# Altium project AVP32F069_EVM_Rev1.1_220623.PrjPcb
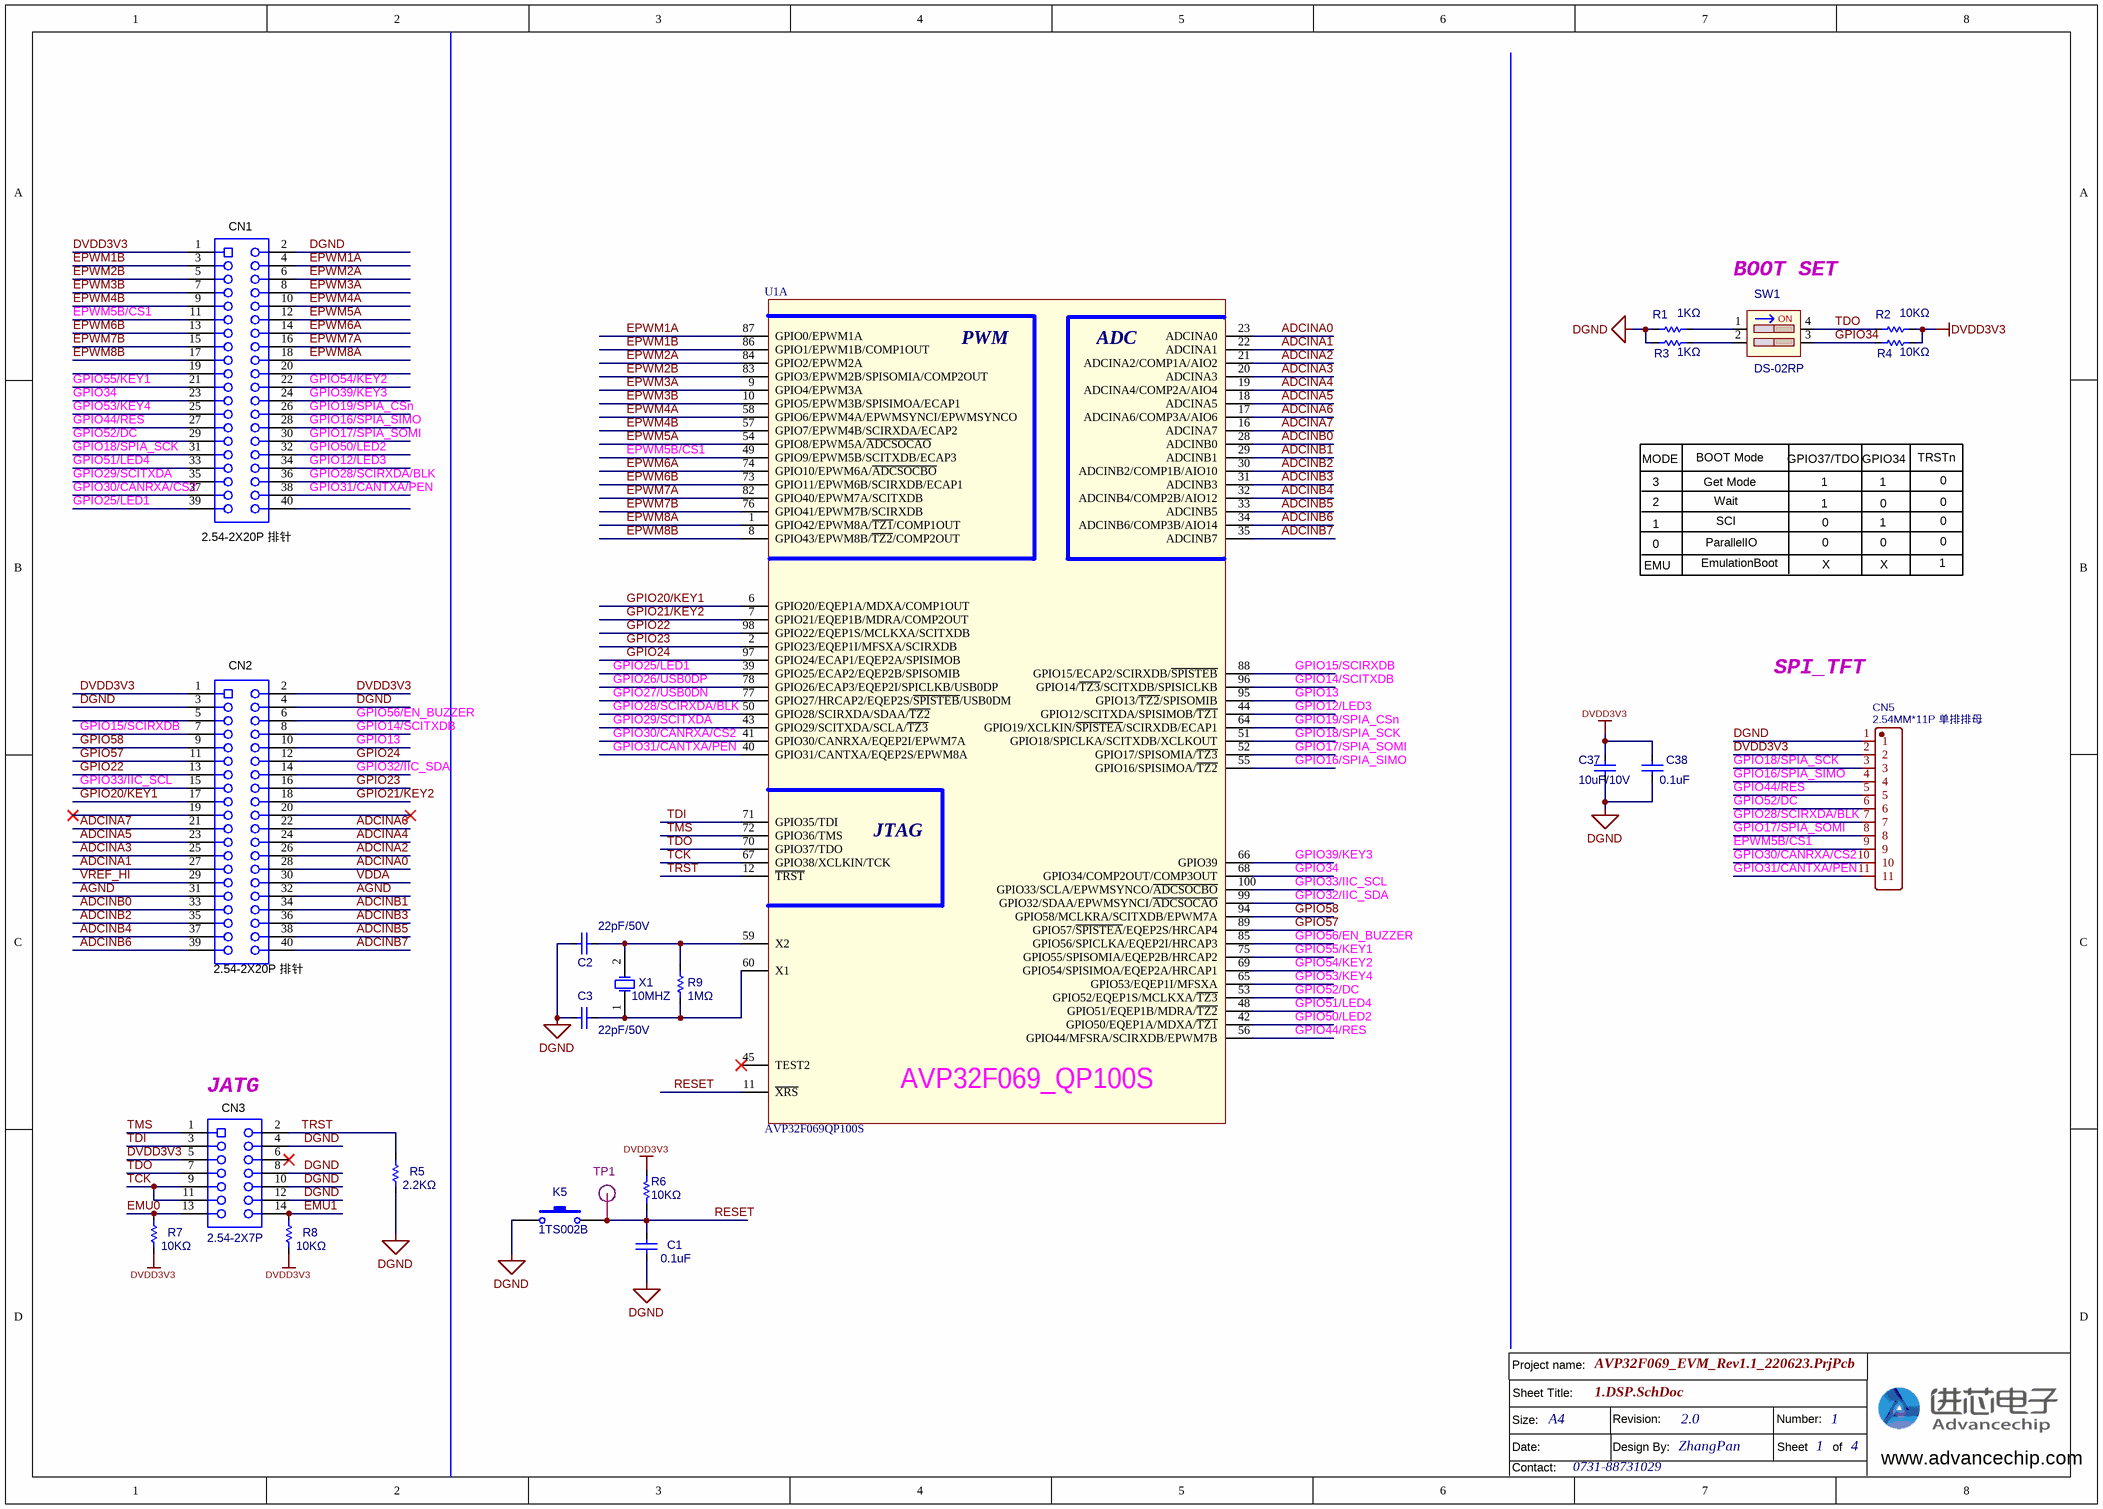
[diagram p0: 1.DSP.SchDoc]
4 sheets, 134 parts. Net scope: global (net labels, ports and power ports of the same name join across sheets).
Board file: AVP32F069_EVM_Rev1.1_220623.PcbDoc
Sheets:
  1.DSP.SchDoc
  2.Power.SchDoc
  3.uC Peripheral.SchDoc
  4.Communication Interface.SchDoc

## Sheet 1.DSP.SchDoc
size A3; Date: 2019/03/06; Author: ZhangPan; Revision: 2.0; SheetNumber: 1; SheetTotal: 4; Size: A4; Contact: 0731-88731029

### Parts
C1  value 0.1uF  [C0603]  (hidden comment: 0.1uF/50V)
C2  22pF/50V  [C0603]
C3  22pF/50V  [C0603]
C37  10uF/10V  [C0805]
C38  value 0.1uF  [C0603]  (hidden comment: 0.1uF/50V)
CN1  2.54-2X20P 排针  [IDC2X20]
CN2  2.54-2X20P 排针  [IDC2X20]
CN3  value 2.54-2X7P  [IDC14-L]  (hidden comment: 2.54-2X7P 简易牛角母座)
CN5  2.54MM*11P 单排排母  [SIP11_TFT]
K5  value 1TS002B  [SW-3X6]  (hidden comment: 1TS002B-2400-5001-CT)
R1  1KΩ  [R0603]
R2  10KΩ  [R0603]
R3  1KΩ  [R0603]
R4  10KΩ  [R0603]
R5  2.2KΩ  [R0603]
R6  10KΩ  [R0603]
R7  10KΩ  [R0603]
R8  10KΩ  [R0603]
R9  1MΩ  [R0603]
SW1  DS-02RP  [DIP-KEY-2]
TP1  RST  [TEST-0.8/1.5MM]  (value not drawn)
U1  AVP32F069QP100S  [LQFP-100]  (part A of 2)
X1  value 10MHZ  [XTAL_5032]  (hidden comment: YSX530GA 10MHZ 20pF 10ppm)

### Nets
AGND: CN2.31 CN2.32
DGND: C1.2 C2.2 C3.1 C37.2 C38.2 CN1.2 CN2.3 CN2.4 CN3.4 CN3.8 CN3.10 CN3.12 CN5.1 K5.2 R1.1 R3.1 R5.1
DVDD3V3: C37.1 C38.1 CN1.1 CN2.1 CN2.2 CN3.5 CN5.2 R2.2 R4.2 R6.1 R7.1 R8.1
VDDA: CN2.30
ADCINA0: CN2.28 U1.23(ADCINA0)
ADCINA1: CN2.27 U1.22(ADCINA1)
ADCINA2: CN2.26 U1.21(ADCINA2/COMP1A/AIO2)
ADCINA3: CN2.25 U1.20(ADCINA3)
ADCINA4: CN2.24 U1.19(ADCINA4/COMP2A/AIO4)
ADCINA5: CN2.23 U1.18(ADCINA5)
ADCINA6: CN2.22 U1.17(ADCINA6/COMP3A/AIO6)
ADCINA7: CN2.21 U1.16(ADCINA7)
ADCINB0: CN2.33 U1.28(ADCINB0)
ADCINB1: CN2.34 U1.29(ADCINB1)
ADCINB2: CN2.35 U1.30(ADCINB2/COMP1B/AIO10)
ADCINB3: CN2.36 U1.31(ADCINB3)
ADCINB4: CN2.37 U1.32(ADCINB4/COMP2B/AIO12)
ADCINB5: CN2.38 U1.33(ADCINB5)
ADCINB6: CN2.39 U1.34(ADCINB6/COMP3B/AIO14)
ADCINB7: CN2.40 U1.35(ADCINB7)
EMU0: CN3.13 R7.2
EMU1: CN3.14 R8.2
EPWM1A: CN1.4 U1.87(GPIO0/EPWM1A)
EPWM1B: CN1.3 U1.86(GPIO1/EPWM1B/COMP1OUT)
EPWM2A: CN1.6 U1.84(GPIO2/EPWM2A)
EPWM2B: CN1.5 U1.83(GPIO3/EPWM2B/SPISOMIA/COMP2OUT)
EPWM3A: CN1.8 U1.9(GPIO4/EPWM3A)
EPWM3B: CN1.7 U1.10(GPIO5/EPWM3B/SPISIMOA/ECAP1)
EPWM4A: CN1.10 U1.58(GPIO6/EPWM4A/EPWMSYNCI/EPWMSYNCO)
EPWM4B: CN1.9 U1.57(GPIO7/EPWM4B/SCIRXDA/ECAP2)
EPWM5A: CN1.12 U1.54(GPIO8/EPWM5A/~{ADCSOCAO})
EPWM5B/CS1: CN1.11 CN5.9 U1.49(GPIO9/EPWM5B/SCITXDB/ECAP3)
EPWM6A: CN1.14 U1.74(GPIO10/EPWM6A/~{ADCSOCBO})
EPWM6B: CN1.13 U1.73(GPIO11/EPWM6B/SCIRXDB/ECAP1)
EPWM7A: CN1.16 U1.82(GPIO40/EPWM7A/SCITXDB)
EPWM7B: CN1.15 U1.76(GPIO41/EPWM7B/SCIRXDB)
EPWM8A: CN1.18 U1.1(GPIO42/EPWM8A/~{TZ1}/COMP1OUT)
EPWM8B: CN1.17 U1.8(GPIO43/EPWM8B/~{TZ2}/COMP2OUT)
GPIO12/LED3: CN1.34 U1.44(GPIO12/SCITXDA/SPISIMOB/~{TZ1})
GPIO13: CN2.10 U1.95(GPIO13/~{TZ2}/SPISOMIB)
GPIO14/SCITXDB: CN2.8 U1.96(GPIO14/~{TZ3}/SCITXDB/SPISICLKB)
GPIO15/SCIRXDB: CN2.7 U1.88(GPIO15/ECAP2/SCIRXDB/~{SPISTEB})
GPIO16/SPIA_SIMO: CN1.28 CN5.4 U1.55(GPIO16/SPISIMOA/~{TZ2})
GPIO17/SPIA_SOMI: CN1.30 CN5.8 U1.52(GPIO17/SPISOMIA/~{TZ3})
GPIO18/SPIA_SCK: CN1.31 CN5.3 U1.51(GPIO18/SPICLKA/SCITXDB/XCLKOUT)
GPIO19/SPIA_CSn: CN1.26 U1.64(GPIO19/XCLKIN/~{SPISTEA}/SCIRXDB/ECAP1)
GPIO20/KEY1: CN2.17 U1.6(GPIO20/EQEP1A/MDXA/COMP1OUT)
GPIO21/KEY2: CN2.18 U1.7(GPIO21/EQEP1B/MDRA/COMP2OUT)
GPIO22: CN2.13 U1.98(GPIO22/EQEP1S/MCLKXA/SCITXDB)
GPIO23: CN2.16 U1.2(GPIO23/EQEP1I/MFSXA/SCIRXDB)
GPIO24: CN2.12 U1.97(GPIO24/ECAP1/EQEP2A/SPISIMOB)
GPIO25/LED1: CN1.39 U1.39(GPIO25/ECAP2/EQEP2B/SPISOMIB)
GPIO26/USB0DP: U1.78(GPIO26/ECAP3/EQEP2I/SPICLKB/USB0DP)
GPIO27/USB0DN: U1.77(GPIO27/HRCAP2/EQEP2S/~{SPISTEB}/USB0DM)
GPIO28/SCIRXDA/BLK: CN1.36 CN5.7 U1.50(GPIO28/SCIRXDA/SDAA/~{TZ2})
GPIO29/SCITXDA: CN1.35 U1.43(GPIO29/SCITXDA/SCLA/~{TZ3})
GPIO30/CANRXA/CS2: CN1.37 CN5.10 U1.41(GPIO30/CANRXA/EQEP2I/EPWM7A)
GPIO31/CANTXA/PEN: CN1.38 CN5.11 U1.40(GPIO31/CANTXA/EQEP2S/EPWM8A)
GPIO32/IIC_SDA: CN2.14 U1.99(GPIO32/SDAA/EPWMSYNCI/~{ADCSOCAO})
GPIO33/IIC_SCL: CN2.15 U1.100(GPIO33/SCLA/EPWMSYNCO/~{ADCSOCBO})
GPIO34: CN1.23 R4.1 SW1.3 U1.68(GPIO34/COMP2OUT/COMP3OUT)
GPIO39/KEY3: CN1.24 U1.66(GPIO39)
GPIO44/RES: CN1.27 CN5.5 U1.56(GPIO44/MFSRA/SCIRXDB/EPWM7B)
GPIO50/LED2: CN1.32 U1.42(GPIO50/EQEP1A/MDXA/~{TZ1})
GPIO51/LED4: CN1.33 U1.48(GPIO51/EQEP1B/MDRA/~{TZ2})
GPIO52/DC: CN1.29 CN5.6 U1.53(GPIO52/EQEP1S/MCLKXA/~{TZ3})
GPIO53/KEY4: CN1.25 U1.65(GPIO53/EQEP1I/MFSXA)
GPIO54/KEY2: CN1.22 U1.69(GPIO54/SPISIMOA/EQEP2A/HRCAP1)
GPIO55/KEY1: CN1.21 U1.75(GPIO55/SPISOMIA/EQEP2B/HRCAP2)
GPIO56/EN_BUZZER: CN2.6 U1.85(GPIO56/SPICLKA/EQEP2I/HRCAP3)
GPIO57: CN2.11 U1.89(GPIO57/~{SPISTEA}/EQEP2S/HRCAP4)
GPIO58: CN2.9 U1.94(GPIO58/MCLKRA/SCITXDB/EPWM7A)
RESET: C1.1 K5.1 R6.2 TP1.1 U1.11(~{XRS})
TCK: CN3.9 CN3.11 U1.67(GPIO38/XCLKIN/TCK)
TDI: CN3.3 U1.71(GPIO35/TDI)
TDO: CN3.7 R2.1 SW1.4 U1.70(GPIO37/TDO)
TMS: CN3.1 U1.72(GPIO36/TMS)
TRST: CN3.2 R5.2 U1.12(~{TRST})
VREF_HI: CN2.29
NetC2_1: C2.1 R9.1 U1.59(X2) X1.2(OSC2)
NetC3_2: C3.2 R9.2 U1.60(X1) X1.1(OSC1)
NetR1_2: R1.2 SW1.1
NetR3_2: R3.2 SW1.2

Not connected (* = marked no-connect by the designer): CN1 19 20 40; CN2 5 19* 20*; CN3 6*; U1 45(TEST2)*

### Notes on the sheet
- BOOT SET
- BOOT Mode
- TRSTn
- 3
- 2
- 1
- MODE
- Wait
- SCI
- Get Mode
- GPIO37/TDO
- 0
- GPIO34
- EMU
- ParallelIO
- EmulationBoot
- X
- SPI_TFT
- (near CN3) JATG
- Sheet Title:
- Project name:
- Size:
- Date:
- Contact:
- Revision:
- Design By:
- Number:
- Sheet       of
- www.advancechip.com
- (in symbol AVP32F069QP100S, part A) PWM; ADC; JTAG; AVP32F069_QP100S
- (in symbol SW-2B) ON

### Library data of the parts
C1 C37 C38 = Cap: 贴片电容; Published: 8-Jun-2000; LatestRevisionDate: 17-Jul-2002; LatestRevisionNote: Re-released for DXP Platform.; Publisher: Altium Limited
  C37: Value: 10uF/10V
C2 C3 = Cap: COG贴片电容; Value: 100pF; Published: 8-Jun-2000; LatestRevisionDate: 17-Jul-2002; LatestRevisionNote: Re-released for DXP Platform.; Publisher: Altium Limited
CN1 CN2 = CON 20X2A: 连接器
CN3 = Receptacle_7X2: 连接器
CN5 = KH-2.54FH-1X11P-H8.5: 连接器; BOM_Manufacturer: kinghelm(金航标); Contributor: LCSC; BOM_Supplier: LCSC; BOM_Supplier Part: C2932674; BOM_Manufacturer Part: KH-2.54FH-1X11P-H8.5; spicePre: U; spiceSymbolName: KH-2.54FH-1X11P-H8.5
K5 = SW-PB: 鸿源精密轻触开关3X6; Published: 24-Mar-1999; LatestRevisionDate: 17-Jul-2002; LatestRevisionNote: Re-released for DXP Platform.; Publisher: Altium Limited
R1-R9 = Res: 贴片电阻; Value: 1K; Published: 8-Jun-2000; LatestRevisionDate: 17-Jul-2002; LatestRevisionNote: Re-released for DXP Platform.; Publisher: Altium Limited
SW1 = SW-2B: 红色2PIN-2.54mm立式直插正拨拨码开关; Published: 24-Mar-1999; LatestRevisionDate: 17-Jul-2002; LatestRevisionNote: Re-released for DXP Platform.; Publisher: Altium Limited
TP1 = TP: 测试点
U1 = AVP32F069QP100S: 进芯32位浮点DSP
X1 = XTAL: 5032贴片无源晶振; Published: 8-Jun-2000; LatestRevisionDate: 17-Jul-2002; LatestRevisionNote: Re-released for DXP Platform.; Publisher: Altium Limited

## Sheet 2.Power.SchDoc: TopLevel Schematic
size A4; Date: 2022/5/12; Author: DaiJun; Revision: 1.0; SheetNumber: 2; SheetTotal: 4; Size: A4; Contact: 0731-88731029
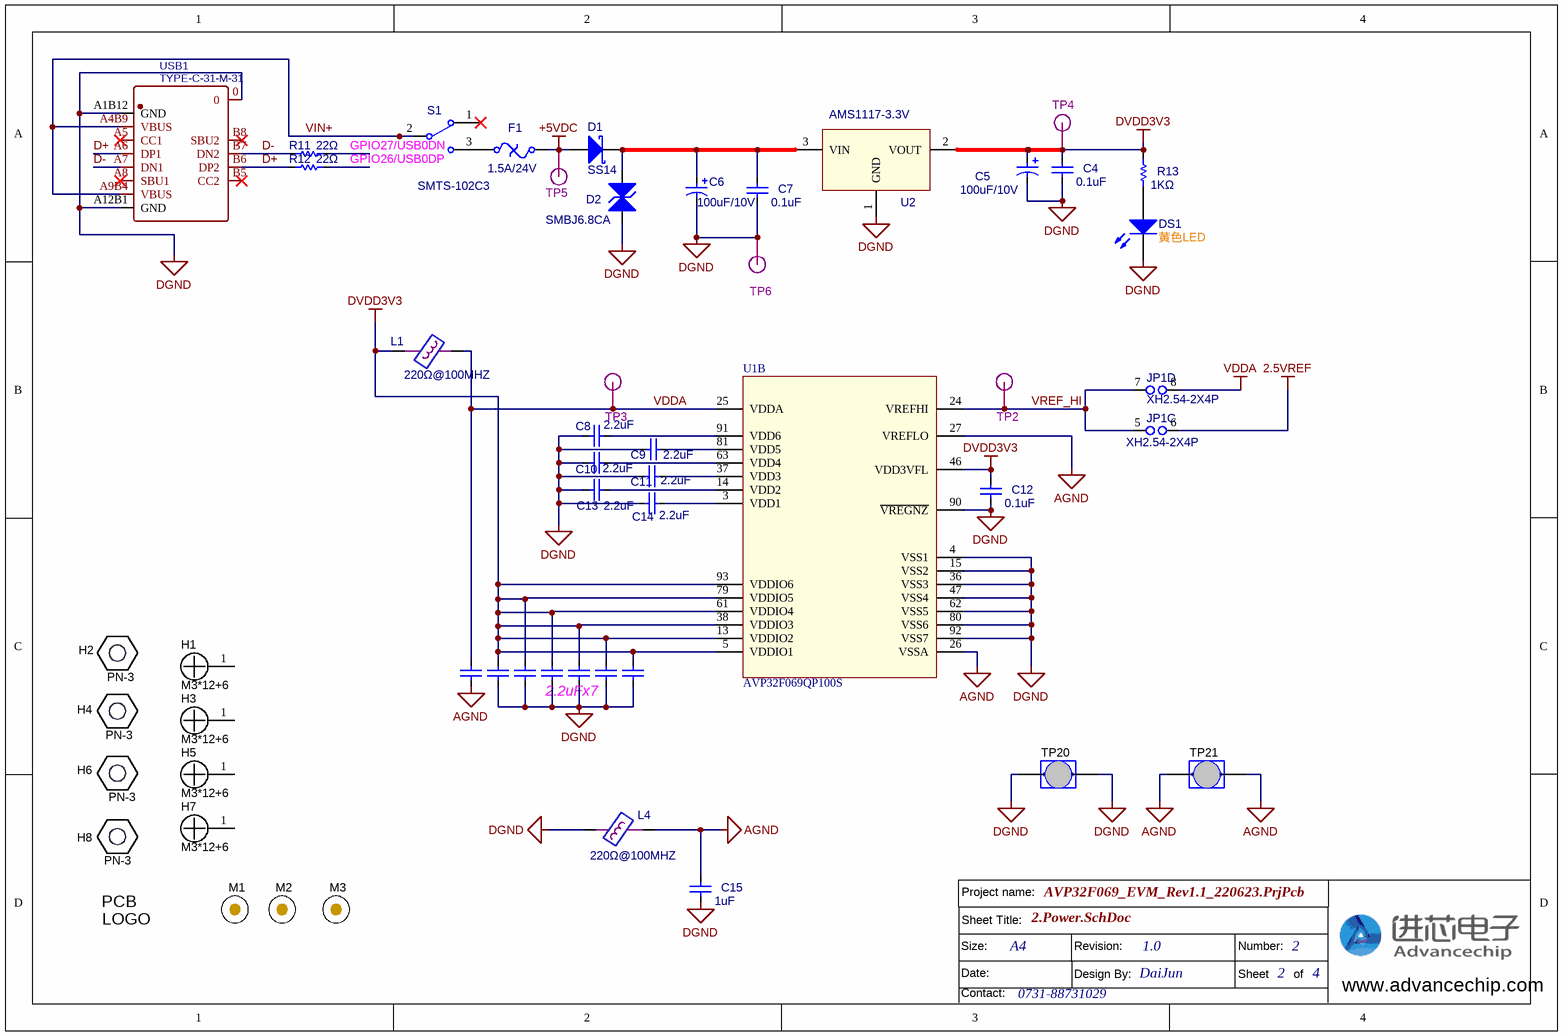
[diagram p1: 2.Power.SchDoc]

### Parts
C4  value 0.1uF  [C0603]  (hidden comment: 0.1uF/50V)
C5  100uF/10V  [CASE-B_3528]
C6  100uF/10V  [CASE-B_3528]
C7  value 0.1uF  [C0603]  (hidden comment: 0.1uF/50V)
C8  value 2.2uF  [C0603]  (hidden comment: 2.2uF/25V)
C9  value 2.2uF  [C0603]  (hidden comment: 2.2uF/25V)
C10  value 2.2uF  [C0603]  (hidden comment: 2.2uF/25V)
C11  value 2.2uF  [C0603]  (hidden comment: 2.2uF/25V)
C12  value 0.1uF  [C0603]  (hidden comment: 0.1uF/50V)
C13  value 2.2uF  [C0603]  (hidden comment: 2.2uF/25V)
C14  value 2.2uF  [C0603]  (hidden comment: 2.2uF/25V)
C15  value 1uF  [C0603]  (hidden comment: 1uF/25V)
C23  2.2uF  [C0603]  (value not drawn)
C26  2.2uF  [C0603]  (value not drawn)
C29  2.2uF  [C0603]  (value not drawn)
C30  2.2uF  [C0603]  (value not drawn)
C31  2.2uF  [C0603]  (value not drawn)
C32  2.2uF  [C0603]  (value not drawn)
C33  2.2uF  [C0603]  (value not drawn)
D1  SS14  [SMA]
D2  SMBJ6.8CA  [SMB2]
DS1  黄色LED  [SMD_LED0805_LED]
F1  1.5A/24V  [1812_PTC_NP]
H1  M3*12+6  [NY PMS 440 0025 PH]
H2  PN-3  [Keystone_1902C]
H3  M3*12+6  [NY PMS 440 0025 PH]
H4  PN-3  [Keystone_1902C]
H5  M3*12+6  [NY PMS 440 0025 PH]
H6  PN-3  [Keystone_1902C]
H7  M3*12+6  [NY PMS 440 0025 PH]
H8  PN-3  [Keystone_1902C]
JP1  XH2.54-2X4P  [SIP4X2A]  (parts C,D of 4)
L1  value 220Ω@100MHZ  [L-0805]  (hidden comment: BLM21PG221SN)
L4  value 220Ω@100MHZ  [L-0805]  (hidden comment: BLM21PG221SN)
Logo1  CAUTION.  READ USER GUIDE BEFORE USE  [IEC_Caution_Small]  (value not drawn)  (no BOM)
M1  (no value)  [Mark1]
M2  (no value)  [Mark1]
M3  (no value)  [Mark1]
R11  22Ω  [0805RX]
R12  22Ω  [0805RX]
R13  1KΩ  [R0603]
S1  SMTS-102C3  [SW2]
TP2  VREFHI  [TEST-0.8/1.5MM]  (value not drawn)
TP3  VDDA  [TEST-0.8/1.5MM]  (value not drawn)
TP4  +3V3  [TEST-0.8/1.5MM]  (value not drawn)
TP5  VIN+  [TEST-0.8/1.5MM]  (value not drawn)
TP6  DGND  [TEST-0.8/1.5MM]  (value not drawn)
TP20  D3082-05  [Harwin_D3082-05]  (value not drawn)
TP21  D3082-05  [Harwin_D3082-05]  (value not drawn)
U1  AVP32F069QP100S  (part B of 2)
U2  AMS1117-3.3V  [SOT-223]
USB1  TYPE-C-31-M-31  [USB-C-SMD-16P]

### Nets
2.5VREF: JP1.6
+5VDC: D1.1 F1.2 TP5.1
AGND: C15.1 C23.1 L4.2 TP21.1 TP21.2 U1.26(VSSA) U1.27(VREFLO)
DGND: C4.2 C5.2 C6.2 C7.2 C8.1 C9.1 C10.1 C11.1 C12.2 C13.1 C14.1 C15.2 C26.1 C29.1 C30.1 C31.1 C32.1 C33.1 D2.1(A) DS1.2(K) L4.1 TP6.1 TP20.1 TP20.2 U1.4(VSS1) U1.15(VSS2) U1.36(VSS3) U1.47(VSS4) U1.62(VSS5) U1.80(VSS6) U1.90(~{VREGNZ}) U1.92(VSS7) U2.1(GND) USB1.0 USB1.A1B12(GND) USB1.A12B1(GND)
DVDD3V3: C4.1 C5.1 C12.1 C26.2 C29.2 C30.2 C31.2 C32.2 C33.2 L1.2 R13.1 TP4.1 U1.5(VDDIO1) U1.13(VDDIO2) U1.38(VDDIO3) U1.46(VDD3VFL) U1.61(VDDIO4) U1.79(VDDIO5) U1.93(VDDIO6) U2.2(VOUT)
VDDA: C23.2 JP1.8 L1.1 TP3.1 U1.25(VDDA)
D+: R12.1 USB1.A6(DP1) USB1.B6(DP2)
D-: R11.1 USB1.A7(DN1) USB1.B7(DN2)
GPIO26/USB0DP: R12.2
GPIO27/USB0DN: R11.2
VIN+: S1.2 USB1.A4B9(VBUS) USB1.A9B4(VBUS)
VREF_HI: JP1.5 JP1.7 TP2.1 U1.24(VREFHI)
NetC6_1: C6.1 C7.1 D1.2 D2.2(K) U2.3(VIN)
NetC8_2: C8.2 U1.81(VDD5)
NetC9_2: C9.2 U1.37(VDD3)
NetC10_2: C10.2 U1.63(VDD4)
NetC11_2: C11.2 U1.14(VDD2)
NetC13_2: C13.2 U1.91(VDD6)
NetC14_2: C14.2 U1.3(VDD1)
NetDS1_1: DS1.1(A) R13.2
NetF1_1: F1.1 S1.3

Not connected (* = marked no-connect by the designer): H1 1; H3 1; H5 1; H7 1; S1 1*; USB1 A5(CC1)* A8(SBU1)* B5(CC2)* B8(SBU2)*

### Notes on the sheet
- 2.2uFx7
- Sheet Title:
- Project name:
- Size:
- Date:
- Contact:
- Revision:
- Design By:
- Number:
- Sheet       of
- www.advancechip.com
- (in symbol CMP-0074836-1) PCB; LOGO

### Library data of the parts
C4 C7-C15 C23 C26 C29-C33 = Cap: 贴片电容; Published: 8-Jun-2000; LatestRevisionDate: 17-Jul-2002; LatestRevisionNote: Re-released for DXP Platform.; Publisher: Altium Limited
  C23 C26 C29-C33: Value: 2.2uF
C5 C6 = CAP2: 钽电容; Brand Name: 三星; Tolerance error: 10%; cost: ￥0.01
D1 = D Schottky: 肖特基二极管; Published: 8-Jun-2000; LatestRevisionDate: 17-Jul-2002; LatestRevisionNote: Re-released for DXP Platform.; Publisher: Altium Limited; Code_JEDEC: DO-214-AA
D2 = TVS: TVS二极管; Published: 8-Jun-2000; LatestRevisionDate: 17-Jul-2002; LatestRevisionNote: Re-released for DXP Platform.; Publisher: Altium Limited
DS1 = LED0: 发光二极管; Published: 8-Jun-2000; LatestRevisionDate: 08-Jul-2005; LatestRevisionNote: Mech Layer 1 removed.; PackageReference: LED-0; Publisher: Altium Limited; PackageDescription: LED; 2 Leads
F1 = Fuse Thermal: 自恢复保险丝; Published: 24-Mar-1999; LatestRevisionDate: 17-Jul-2002; LatestRevisionNote: Re-released for DXP Platform.; PackageReference: PIN-W2/E2.8; Publisher: Altium Limited
H1 H3 H5 H7 = CMP-0003617-1: 安装孔
H2 H4 H6 H8 = CMP-0003610-1: Standoff, Hex, 0.5"L #4-40 Nylon
JP1 = Jumper2: 2.54双排插针; Published: 24-Mar-1999; LatestRevisionDate: 17-Jul-2002; LatestRevisionNote: Re-released for DXP Platform.; Publisher: Altium Limited
L1 L4 = FB1: 贴片电感; Code_IEC: 1005; Published: 8-Jun-2000; LatestRevisionDate: 29-May-2009; LatestRevisionNote: IPC-7351 Footprint Added.; PackageReference: 0402-A; Publisher: Altium Limited; PackageDescription: Chip Inductor; Code_JEITA: 0402
Logo1 = CMP-0074836-1: IEC 61010-1 Caution Warning
M1-M3 = CMP-0077181-1: MARK点
R11-R13 = Res: 贴片电阻; Value: 1K; Published: 8-Jun-2000; LatestRevisionDate: 17-Jul-2002; LatestRevisionNote: Re-released for DXP Platform.; Publisher: Altium Limited
S1 = SW-SPDT: 红色卧式弯脚小型扭子开关5脚2档; Published: 24-Mar-1999; LatestRevisionDate: 17-Dec-2003; LatestRevisionNote: Schematic revised, PCB Footprint replaced.; DatasheetDocument: 05-Dec-2000; Publisher: Altium Limited
TP2-TP6 = TP: 测试点
TP20 TP21 = CMP-0075110-1: 锰铜采样电阻 脚距10mm; Manufacturer: Harwin; CompType: Jumper Wire; CNHeader: False; Green_Lifecycle: Active; Green_REACh: Passed; PartNumber: D3082-05; PackageReference: Shorting Plug, 10.16mm spacing, TH; RoHS: Y; MountType: TH; ComponentLink1Description: Datasheet URL; ComponentLink1URL: http://cdn.harwin.com/pdfs/D3080-D3083.pdf; Publisher: Texas Instruments; LatestRevisionDate: 2017-07-12; Supplier 1: Digi-Key; Supplier Part Number 1: 952-1873-ND; Supplier 2: Newark; Supplier Part Number 2: 01E9240; Supplier 3: Mouser; Supplier Part Number 3: 855-D3082-05; CT: False; Green_EU RoHS-2: Passed; Green_EU RoHS: Passed with Exemption
U1 = AVP32F069QP100S: 进芯32位浮点DSP
U2 = ASM1117-3.3V: 线性稳压器
USB1 = TYPE-C-31-M-31: Type-C 母座 卧贴; BOM_Manufacturer: 韩国韩荣; Contributor: LCSC; BOM_Supplier: LCSC; BOM_Supplier Part: C2760486; BOM_Manufacturer Part: TYPE-C-31-M-31; JLCPCB Part Class: Extended Part; BOM_JLCPCB Part Class: Extended Part; spicePre: U; spiceSymbolName: TYPE-C-31-M-31

## Sheet 3.uC Peripheral.SchDoc: TopLevel Schematic
size A3; Date: 2019/03/06; Author: ZhangPan; Revision: 2.0; SheetNumber: 3; SheetTotal: 4; Size: A4; Contact: 0731-88731029; ProjectName: EVM
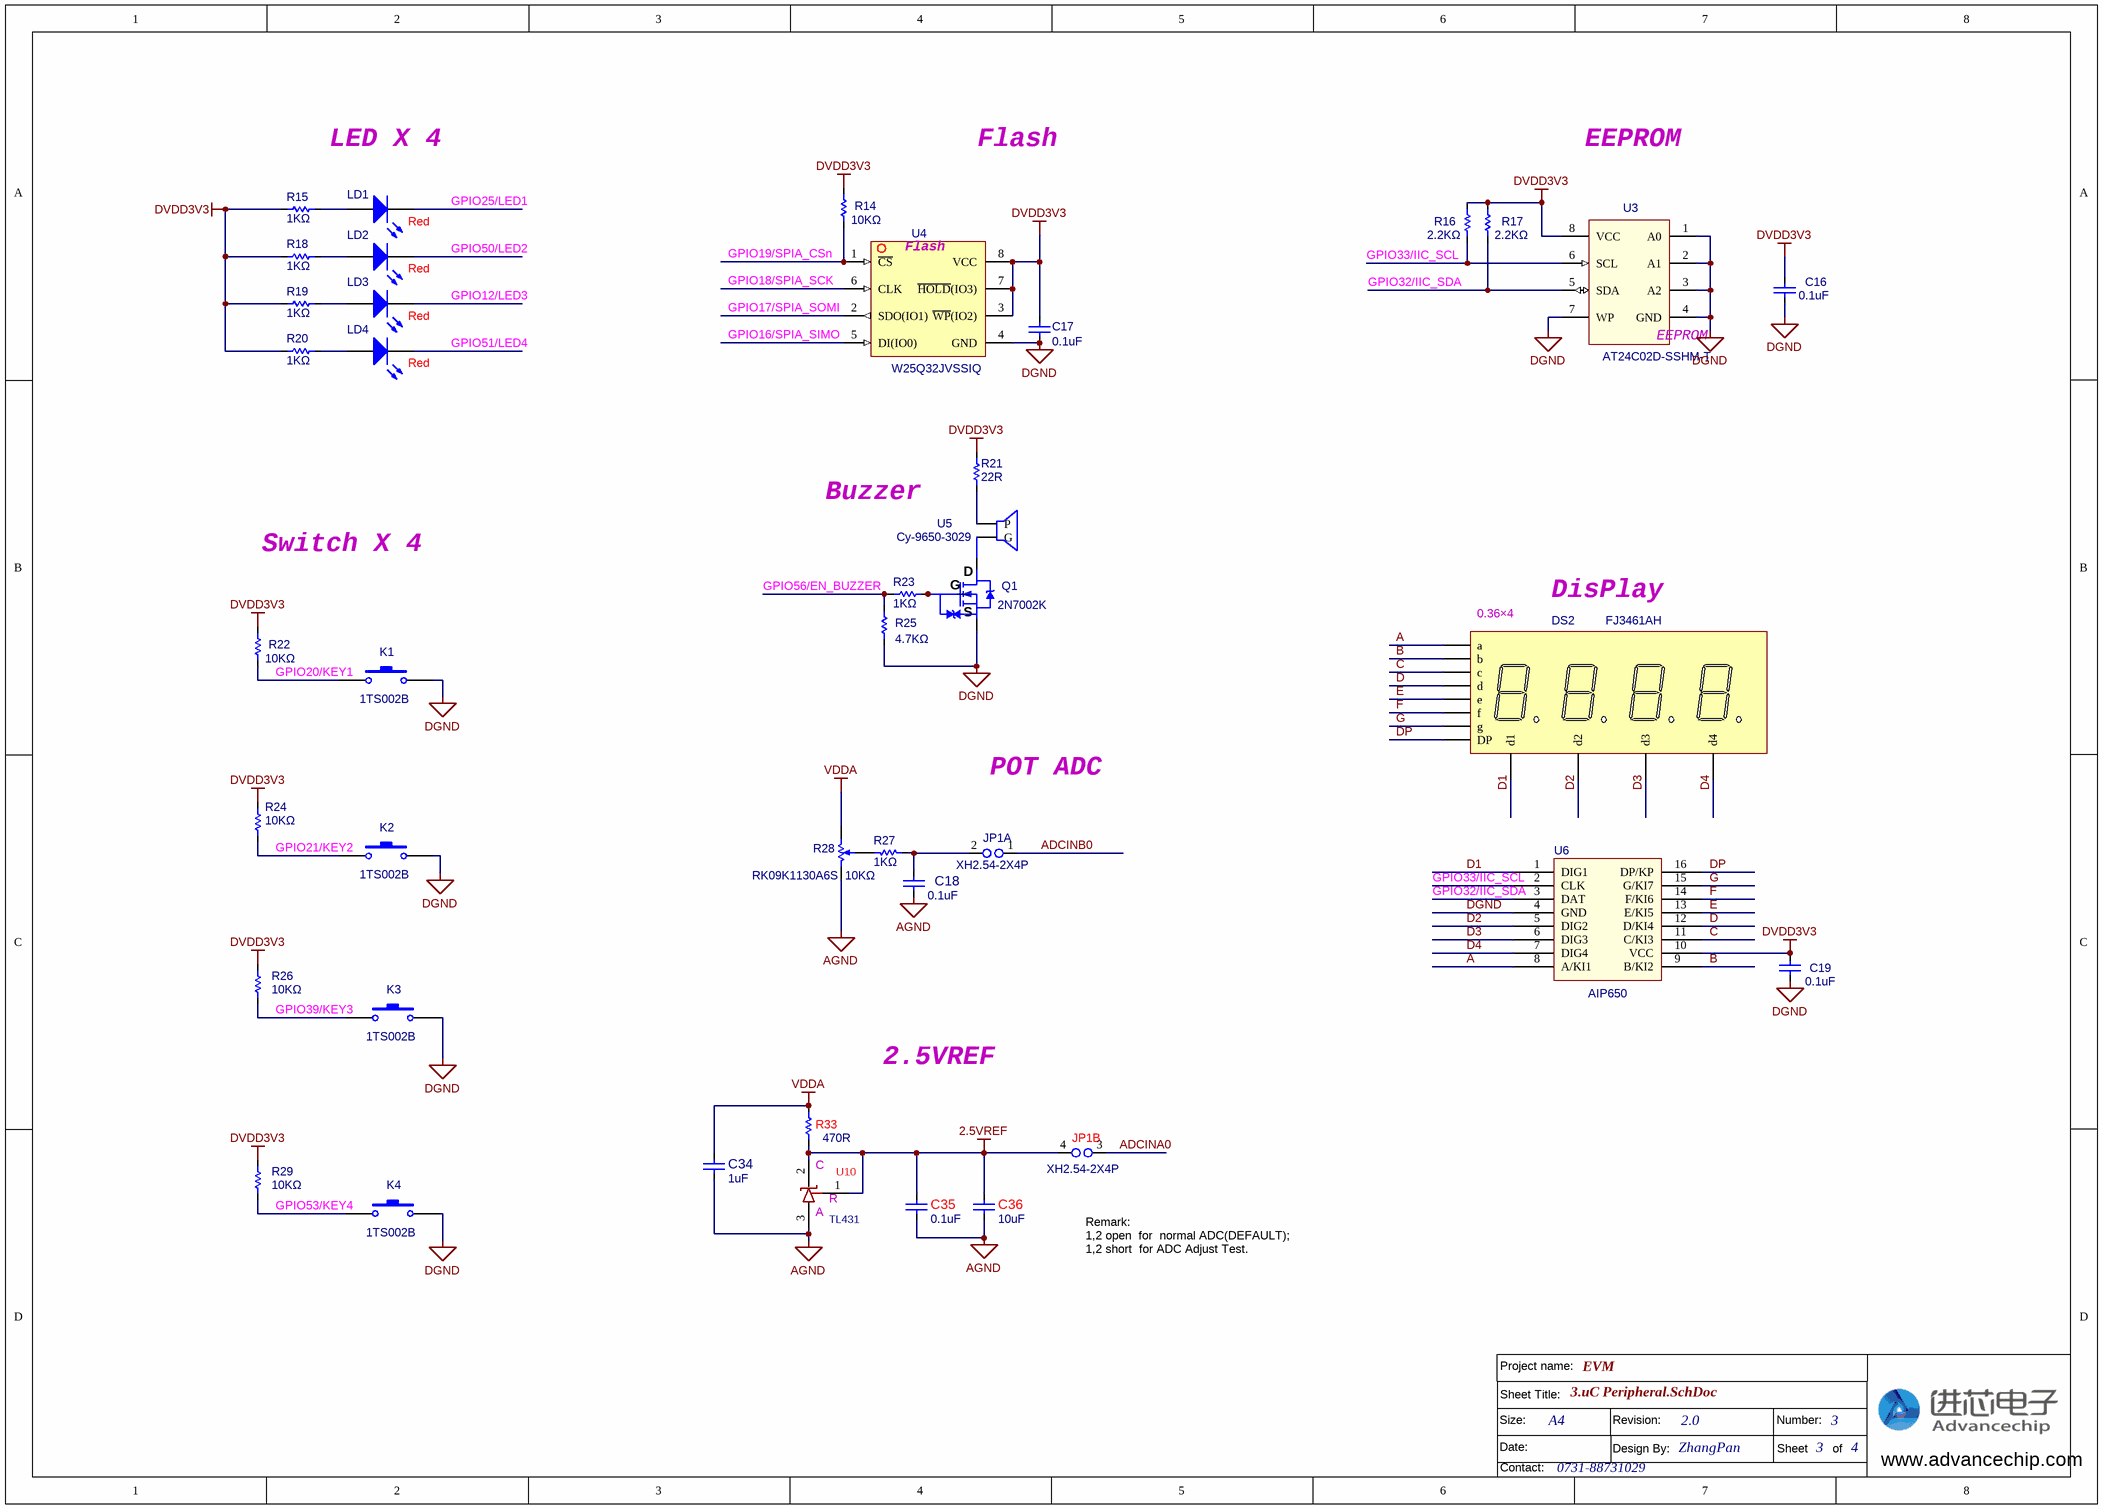
[diagram p2: 3.uC Peripheral.SchDoc]

### Parts
C16  value 0.1uF  [C0603]  (hidden comment: 0.1uF/50V)
C17  value 0.1uF  [C0603]  (hidden comment: 0.1uF/50V)
C18  value 0.1uF  [C0603]  (hidden comment: 0.1uF/50V)
C19  value 0.1uF  [C0603]  (hidden comment: 0.1uF/50V)
C34  value 1uF  [C0603]  (hidden comment: 1uF/25V)
C35  value 0.1uF  [C0603]  (hidden comment: 0.1uF/50V)
C36  value 10uF  [C0805]  (hidden comment: 10uF/10V)
DS2  FJ3461AH  value 0.36×4  [0.36X4]
JP1  XH2.54-2X4P  [SIP4X2A]  (parts A,B of 4)
K1  value 1TS002B  [SW-3X6]  (hidden comment: 1TS002B-2400-5001-CT)
K2  value 1TS002B  [SW-3X6]  (hidden comment: 1TS002B-2400-5001-CT)
K3  value 1TS002B  [SW-3X6]  (hidden comment: 1TS002B-2400-5001-CT)
K4  value 1TS002B  [SW-3X6]  (hidden comment: 1TS002B-2400-5001-CT)
LD1  Red  [SMD_LED0805_LED]
LD2  Red  [SMD_LED0805_LED]
LD3  Red  [SMD_LED0805_LED]
LD4  Red  [SMD_LED0805_LED]
Q1  2N7002K  [MOS-SOT23]
R14  10KΩ  [R0603]
R15  1KΩ  [R0603]
R16  2.2KΩ  [R0603]
R17  2.2KΩ  [R0603]
R18  1KΩ  [R0603]
R19  1KΩ  [R0603]
R20  1KΩ  [R0603]
R21  22R  [1206RX]
R22  10KΩ  [R0603]
R23  1KΩ  [R0603]
R24  10KΩ  [R0603]
R25  4.7KΩ  [R0603]
R26  10KΩ  [R0603]
R27  1KΩ  [R0603]
R28  RK09K1130A6S  10KΩ  [RK09K1130]
R29  10KΩ  [R0603]
R33  470R  [R0603]
U3  AT24C02D-SSHM-T  [SO-8]
U4  W25Q32JVSSIQ  [SOIC-8_208mil]
U5  Cy-9650-3029  [SUN-0905-3V]
U6  AIP650  [SOIC-16_150mil]
U10  TL431  [SOT-23]

### Nets
2.5VREF: C35.1 C36.1 JP1.4 R33.2 U10.1(R) U10.2(C)
AGND: C18.2 C34.2 C35.2 C36.2 R28.1 U10.3(A)
DGND: C16.2 C17.2 C19.2 K1.2 K2.2 K3.2 K4.2 Q1.S R25.2 U3.1(A0) U3.2(A1) U3.3(A2) U3.4(GND) U3.7(WP) U4.4(GND) U6.4(GND)
DVDD3V3: C16.1 C17.1 C19.1 R14.1 R15.2 R16.2 R17.2 R18.2 R19.2 R20.2 R21.1 R22.1 R24.1 R26.1 R29.1 U3.8(VCC) U4.3(~{WP}(IO2)) U4.7(~{HOLD}(IO3)) U4.8(VCC) U6.10(VCC)
VDDA: C34.1 R28.3 R33.1
A: DS2.a U6.8(A/KI1)
ADCINA0: JP1.3
ADCINB0: JP1.1
B: DS2.b U6.9(B/KI2)
C: DS2.c U6.11(C/KI3)
D: DS2.d U6.12(D/KI4)
D1: DS2.com1(d1) U6.1(DIG1)
D2: DS2.com2(d2) U6.5(DIG2)
D3: DS2.com3(d3) U6.6(DIG3)
D4: DS2.com4(d4) U6.7(DIG4)
DP: DS2.dp(DP) U6.16(DP/KP)
E: DS2.e U6.13(E/KI5)
F: DS2.f U6.14(F/KI6)
G: DS2.g U6.15(G/KI7)
GPIO12/LED3: LD3.2(K)
GPIO16/SPIA_SIMO: U4.5(DI(IO0))
GPIO17/SPIA_SOMI: U4.2(SDO(IO1))
GPIO18/SPIA_SCK: U4.6(CLK)
GPIO19/SPIA_CSn: R14.2 U4.1(~{CS})
GPIO20/KEY1: K1.1 R22.2
GPIO21/KEY2: K2.1 R24.2
GPIO25/LED1: LD1.2(K)
GPIO32/IIC_SDA: R17.1 U3.5(SDA) U6.3(DAT)
GPIO33/IIC_SCL: R16.1 U3.6(SCL) U6.2(CLK)
GPIO39/KEY3: K3.1 R26.2
GPIO50/LED2: LD2.2(K)
GPIO51/LED4: LD4.2(K)
GPIO53/KEY4: K4.1 R29.2
GPIO56/EN_BUZZER: R23.2 R25.1
NetC18_1: C18.1 JP1.2 R27.2
NetLD1_1: LD1.1(A) R15.1
NetLD2_1: LD2.1(A) R18.1
NetLD3_1: LD3.1(A) R19.1
NetLD4_1: LD4.1(A) R20.1
NetQ1_D: Q1.D U5.2(G)
NetQ1_G: Q1.G R23.1
NetR21_2: R21.2 U5.1(P)
NetR27_1: R27.1 R28.2

### Notes on the sheet
- LED X 4
- Flash
- EEPROM
- Buzzer
- Switch X 4
- (near DS2) DisPlay
- POT ADC
- 2.5VREF
- Remark:
  1,2 open  for  normal ADC(DEFAULT);
  1,2 short  for ADC Adjust Test.
- Sheet Title:
- Project name:
- Size:
- Date:
- Contact:
- Revision:
- Design By:
- Number:
- Sheet       of
- www.advancechip.com
- (in symbol AT24C02C) EEPROM
- (in symbol W25Q128) Flash

### Library data of the parts
C16-C19 C34-C36 = Cap: 贴片电容; Published: 8-Jun-2000; LatestRevisionDate: 17-Jul-2002; LatestRevisionNote: Re-released for DXP Platform.; Publisher: Altium Limited
DS2 = Dpy Amber-4K: 4位0.36英寸红色共阴七段数码管; 焊接类型: 直插; ComponentLink1URL: *; ComponentLink2Description: *; ComponentLink2URL: *; ComponentLink3Description: *; ComponentLink3URL: *; Pin: 12
JP1 = Jumper2: 2.54双排插针; Published: 24-Mar-1999; LatestRevisionDate: 17-Jul-2002; LatestRevisionNote: Re-released for DXP Platform.; Publisher: Altium Limited
K1-K4 = SW-PB: 鸿源精密轻触开关3X6; Published: 24-Mar-1999; LatestRevisionDate: 17-Jul-2002; LatestRevisionNote: Re-released for DXP Platform.; Publisher: Altium Limited
LD1-LD4 = LED0: 发光二极管; Published: 8-Jun-2000; LatestRevisionDate: 08-Jul-2005; LatestRevisionNote: Mech Layer 1 removed.; PackageReference: LED-0; Publisher: Altium Limited; PackageDescription: LED; 2 Leads
Q1 = 2SK3019: N-MOSFET 60V300mA低开启电压; Published: 8-Jun-2000; LatestRevisionDate: 17-Jul-2002; LatestRevisionNote: Re-released for DXP Platform.; Publisher: Altium Limited
R14-R27 R29 = Res: 贴片电阻; Value: 1K; Published: 8-Jun-2000; LatestRevisionDate: 17-Jul-2002; LatestRevisionNote: Re-released for DXP Platform.; Publisher: Altium Limited
R28 = RPot SM: 立式可调电位器; Published: 17-Dec-2003; DatasheetDocument: Oct-2003; Publisher: Altium Limited
R33 = Res: 贴片电阻; Temperature Coefficient: 100ppm/ ℃; Tolerance: 1%; Voltage Rating: 75V; Power Rating: 1/10W; Operating Temperature Range: -55~+125℃; Category: 贴片电阻; PackageReference: 0603; Composition: Thick Film; MountType: Surface Mount (SMD - SMT); RoHS: Y; Supplier 2: 1; Storage Room  Code: 000000
U3 = AT24C02C: EEPROM存储器
U4 = W25Q128: 华邦FLASH存储器
U5 = BEEP: 超音V有源蜂鸣器 电磁式 脚距5,外径9.5mm
U6 = AIP650E: 无锡中微LED驱动芯片
U10 = AZ431AN-ATRE1: 2.5V基准芯片 0.5%, 1R,2C,3A; spiceSymbolName: https://item.szlcsc.com/192500.html

## Sheet 4.Communication Interface.SchDoc
size A4; Author: DaiJun; Revision: 1.0; SheetNumber: 4; SheetTotal: 4; Size: A3; Contact: 0731-88731029
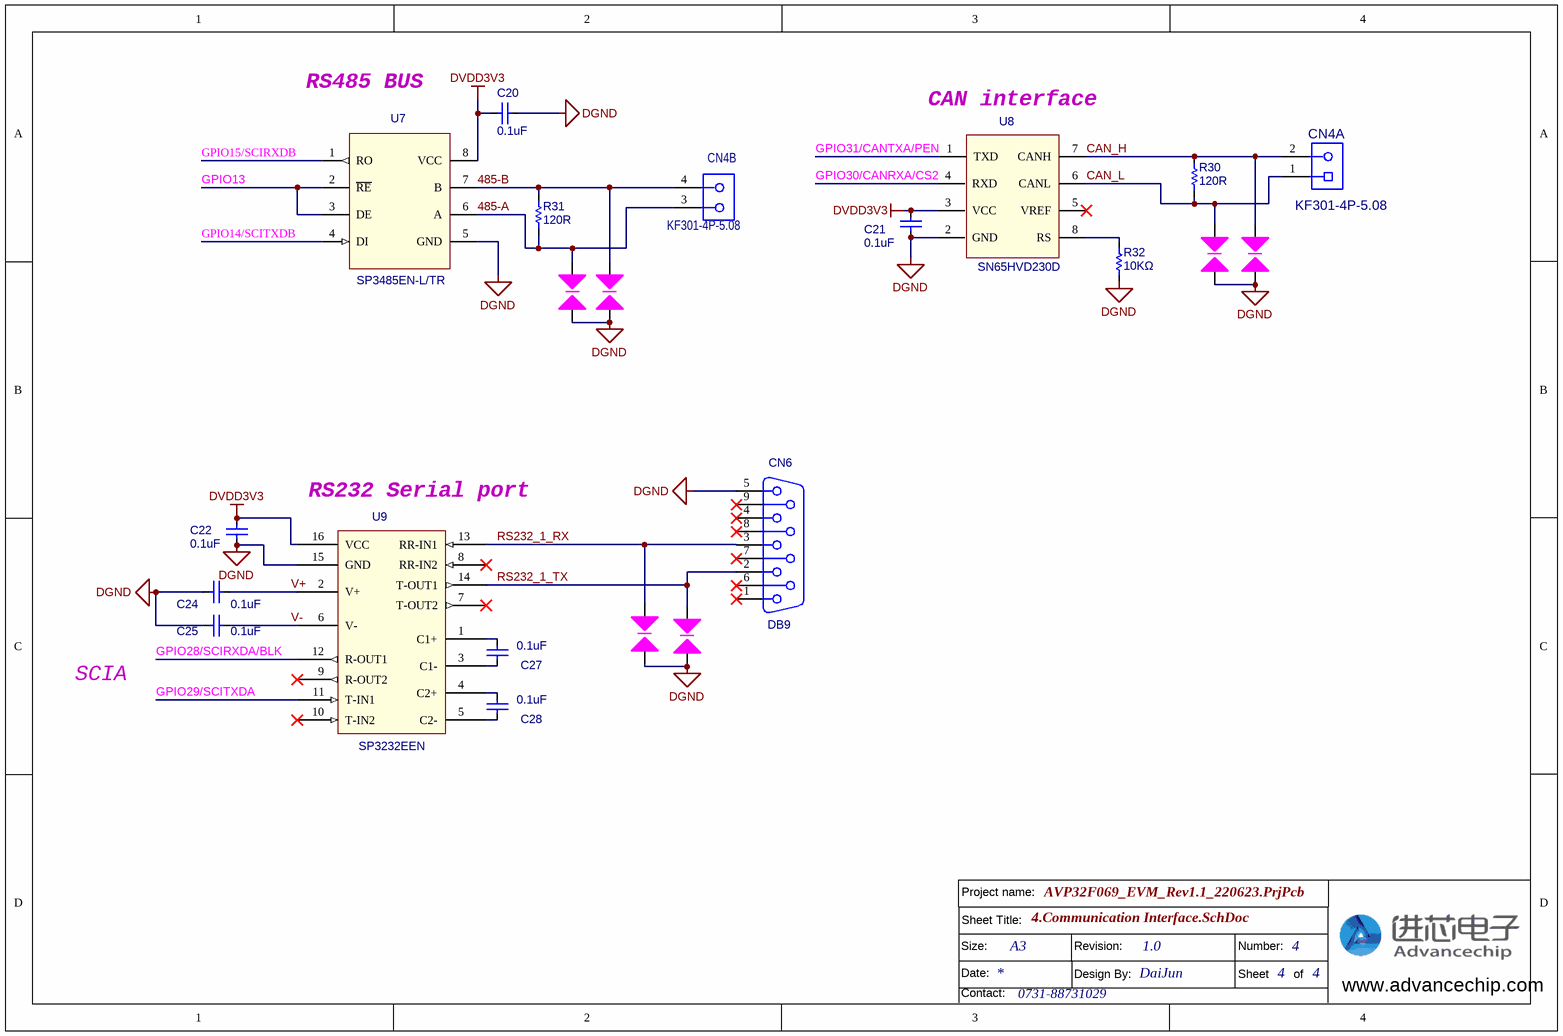
[diagram p3: 4.Communication Interface.SchDoc]

### Parts
C20  value 0.1uF  [C0603]  (hidden comment: 0.1uF/50V)
C21  value 0.1uF  [C0603]  (hidden comment: 0.1uF/50V)
C22  value 0.1uF  [C0603]  (hidden comment: 0.1uF/50V)
C24  value 0.1uF  [C0603]  (hidden comment: 0.1uF/50V)
C25  value 0.1uF  [C0603]  (hidden comment: 0.1uF/50V)
C27  value 0.1uF  [C0603]  (hidden comment: 0.1uF/50V)
C28  value 0.1uF  [C0603]  (hidden comment: 0.1uF/50V)
CN4  KF301-4P-5.08  [J-DG128-4]  (parts A,B of 2)
CN6  DB9  [db9]
R30  120R  [1206RX]
R31  120R  [1206RX]
R32  10KΩ  [R0603]
T1  SPARK_GAP  [SPARK_GAP]  (value not drawn)
T2  SPARK_GAP  [SPARK_GAP]  (value not drawn)
T3  SPARK_GAP  [SPARK_GAP]  (value not drawn)
T4  SPARK_GAP  [SPARK_GAP]  (value not drawn)
T5  SPARK_GAP  [SPARK_GAP]  (value not drawn)
T6  SPARK_GAP  [SPARK_GAP]  (value not drawn)
U7  SP3485EN-L/TR  [SO-8]
U8  SN65HVD230D  [SO-8]
U9  SP3232EEN  [SOIC-16_150mil]

### Nets
DGND: C20.2 C21.2 C22.2 C24.2 C25.2 CN6.5 R32.1 T1.2(A) T2.2(A) T3.2(A) T4.2(A) T5.2(A) T6.2(A) U7.5(GND) U8.2(GND) U9.15(GND)
DVDD3V3: C20.1 C21.1 C22.1 U7.8(VCC) U8.3(VCC) U9.16(VCC)
485-A: CN4.3 R31.1 T3.1(A) U7.6(A)
485-B: CN4.4 R31.2 T4.1(A) U7.7(B)
CAN_H: CN4.2 R30.2 T2.1(A) U8.7(CANH)
CAN_L: CN4.1 R30.1 T1.1(A) U8.6(CANL)
GPIO13: U7.2(~{RE}) U7.3(DE)
GPIO14/SCITXDB: U7.4(DI)
GPIO15/SCIRXDB: U7.1(RO)
GPIO28/SCIRXDA/BLK: U9.12(R-OUT1)
GPIO29/SCITXDA: U9.11(T-IN1)
GPIO30/CANRXA/CS2: U8.4(RXD)
GPIO31/CANTXA/PEN: U8.1(TXD)
RS232_1_RX: CN6.3 T5.1(A) U9.13(RR-IN1)
RS232_1_TX: CN6.2 T6.1(A) U9.14(T-OUT1)
V+: C24.1 U9.2(V+)
V-: C25.1 U9.6(V-)
NetC27_1: C27.1 U9.1(C1+)
NetC27_2: C27.2 U9.3(C1-)
NetC28_1: C28.1 U9.4(C2+)
NetC28_2: C28.2 U9.5(C2-)
NetR32_2: R32.2 U8.8(RS)

Not connected (* = marked no-connect by the designer): CN6 1* 4* 6* 7* 8* 9*; U8 5(VREF)*; U9 7(T-OUT2)* 8(RR-IN2)* 9(R-OUT2)* 10(T-IN2)*

### Notes on the sheet
- RS485 BUS
- (near U8) CAN interface
- (near U9) RS232 Serial port
- SCIA
- Sheet Title:
- Project name:
- Size:
- Date:
- Contact:
- Revision:
- Design By:
- Number:
- Sheet       of
- www.advancechip.com

### Library data of the parts
C20-C22 C24 C25 C27 C28 = Cap: 贴片电容; Published: 8-Jun-2000; LatestRevisionDate: 17-Jul-2002; LatestRevisionNote: Re-released for DXP Platform.; Publisher: Altium Limited
CN4 = CON4: 连接器
CN6 = D Connector 9: DB9插座; PackageDocument: O; Positions: 9; Gender: Receptacle; Published: 15-Jun-2001; LatestRevisionDate: 17-Jul-2002; LatestRevisionNote: Re-released for DXP Platform.; DatasheetDocument: 1-Sep-1999; PackageReference: 788750; Publisher: Altium Limited; Orientation: Right Angle
R30 = Res: 贴片电阻; Published: 8-Jun-2000; LatestRevisionDate: 17-Jul-2002; LatestRevisionNote: Re-released for DXP Platform.; Publisher: Altium Limited
R31 R32 = Res: 贴片电阻; Value: 1K; Published: 8-Jun-2000; LatestRevisionDate: 17-Jul-2002; LatestRevisionNote: Re-released for DXP Platform.; Publisher: Altium Limited
T1-T6 = GND SIDE: 静电GAP
U7 = SP3485E: 3.3V 485总线收发器
U8 = SN65HVD230D: 3.3V CAN通讯
U9 = MAX232: 低压232通讯芯片

## Nets that join several sheets
2.5VREF: 2.Power (JP1.6), 3.uC Peripheral (6 pins)
AGND: 1.DSP (CN2.31 CN2.32), 2.Power (7 pins), 3.uC Peripheral (6 pins)
DGND: 1.DSP (17 pins), 2.Power (36 pins), 3.uC Peripheral (16 pins), 4.Communication Interface (16 pins)
DVDD3V3: 1.DSP (12 pins), 2.Power (20 pins), 3.uC Peripheral (20 pins), 4.Communication Interface (6 pins)
VDDA: 1.DSP (CN2.30), 2.Power (5 pins), 3.uC Peripheral (C34.1 R28.3 R33.1)
ADCINA0: 1.DSP (CN2.28 U1.23), 3.uC Peripheral (JP1.3)
ADCINB0: 1.DSP (CN2.33 U1.28), 3.uC Peripheral (JP1.1)
GPIO12/LED3: 1.DSP (CN1.34 U1.44), 3.uC Peripheral (LD3.2)
GPIO13: 1.DSP (CN2.10 U1.95), 4.Communication Interface (U7.2 U7.3)
GPIO14/SCITXDB: 1.DSP (CN2.8 U1.96), 4.Communication Interface (U7.4)
GPIO15/SCIRXDB: 1.DSP (CN2.7 U1.88), 4.Communication Interface (U7.1)
GPIO16/SPIA_SIMO: 1.DSP (CN1.28 CN5.4 U1.55), 3.uC Peripheral (U4.5)
GPIO17/SPIA_SOMI: 1.DSP (CN1.30 CN5.8 U1.52), 3.uC Peripheral (U4.2)
GPIO18/SPIA_SCK: 1.DSP (CN1.31 CN5.3 U1.51), 3.uC Peripheral (U4.6)
GPIO19/SPIA_CSn: 1.DSP (CN1.26 U1.64), 3.uC Peripheral (R14.2 U4.1)
GPIO20/KEY1: 1.DSP (CN2.17 U1.6), 3.uC Peripheral (K1.1 R22.2)
GPIO21/KEY2: 1.DSP (CN2.18 U1.7), 3.uC Peripheral (K2.1 R24.2)
GPIO25/LED1: 1.DSP (CN1.39 U1.39), 3.uC Peripheral (LD1.2)
GPIO26/USB0DP: 1.DSP (U1.78), 2.Power (R12.2)
GPIO27/USB0DN: 1.DSP (U1.77), 2.Power (R11.2)
GPIO28/SCIRXDA/BLK: 1.DSP (CN1.36 CN5.7 U1.50), 4.Communication Interface (U9.12)
GPIO29/SCITXDA: 1.DSP (CN1.35 U1.43), 4.Communication Interface (U9.11)
GPIO30/CANRXA/CS2: 1.DSP (CN1.37 CN5.10 U1.41), 4.Communication Interface (U8.4)
GPIO31/CANTXA/PEN: 1.DSP (CN1.38 CN5.11 U1.40), 4.Communication Interface (U8.1)
GPIO32/IIC_SDA: 1.DSP (CN2.14 U1.99), 3.uC Peripheral (R17.1 U3.5 U6.3)
GPIO33/IIC_SCL: 1.DSP (CN2.15 U1.100), 3.uC Peripheral (R16.1 U3.6 U6.2)
GPIO39/KEY3: 1.DSP (CN1.24 U1.66), 3.uC Peripheral (K3.1 R26.2)
GPIO50/LED2: 1.DSP (CN1.32 U1.42), 3.uC Peripheral (LD2.2)
GPIO51/LED4: 1.DSP (CN1.33 U1.48), 3.uC Peripheral (LD4.2)
GPIO53/KEY4: 1.DSP (CN1.25 U1.65), 3.uC Peripheral (K4.1 R29.2)
GPIO56/EN_BUZZER: 1.DSP (CN2.6 U1.85), 3.uC Peripheral (R23.2 R25.1)
VREF_HI: 1.DSP (CN2.29), 2.Power (JP1.5 JP1.7 TP2.1 U1.24)